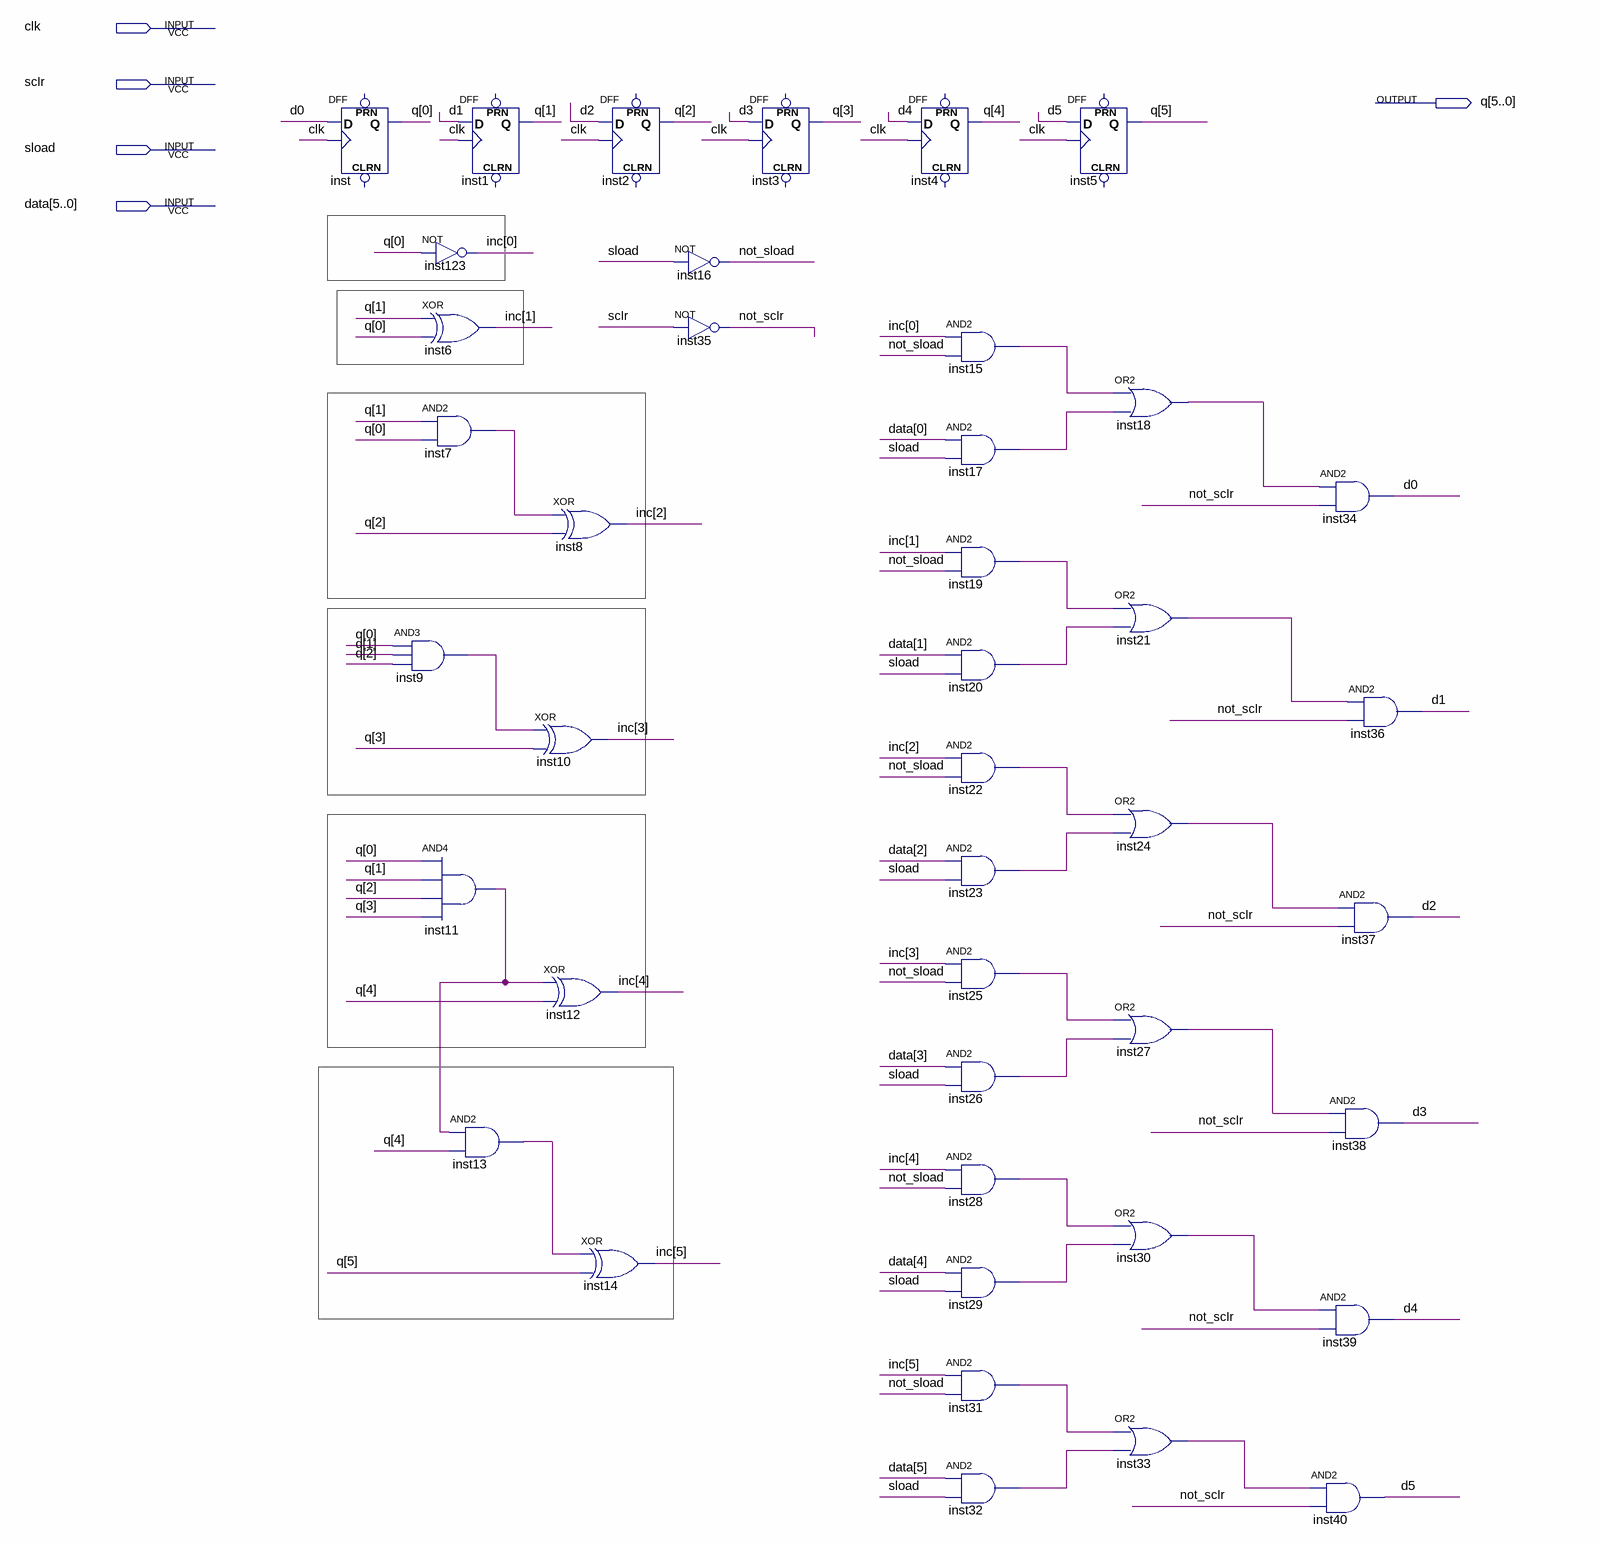
[diagram p0: schematic sheet]
// Quartus schematic contador_6bits.bdf as structural Verilog: 42 symbols, 5 pins
module contador_6bits (
  input  clk,
  input  sclr,
  input  sload,
  input  [5:0] data,
  output [5:0] q
);

  wire d0, d1, d2, d3, d4, d5, inst7_out, inst9_out, inst11_out, inst13_out, inst15_out, inst17_out,
       inst18_out, inst19_out, inst20_out, inst21_out, inst22_out, inst23_out, inst24_out, inst25_out,
       inst26_out, inst27_out, inst28_out, inst29_out, inst30_out, inst31_out, inst32_out, inst33_out,
       not_sclr, not_sload;
  wire [5:0] inc;

  DFF inst (.CLK(clk), .D(d0), .Q(q[0]));  // open: CLRN, PRN
  not inst123 (inc[0], q[0]);
  xor inst6 (inc[1], q[1], q[0]);
  and inst7 (inst7_out, q[1], q[0]);
  and inst9 (inst9_out, q[0], q[1], q[2]);
  and inst11 (inst11_out, q[0], q[1], q[2], q[3]);
  DFF inst1 (.CLK(clk), .D(d1), .Q(q[1]));  // open: CLRN, PRN
  and inst13 (inst13_out, inst11_out, q[4]);
  xor inst8 (inc[2], inst7_out, q[2]);
  xor inst10 (inc[3], inst9_out, q[3]);
  xor inst12 (inc[4], inst11_out, q[4]);
  xor inst14 (inc[5], inst13_out, q[5]);
  DFF inst2 (.CLK(clk), .D(d2), .Q(q[2]));  // open: CLRN, PRN
  not inst16 (not_sload, sload);
  not inst35 (not_sclr, sclr);
  DFF inst3 (.CLK(clk), .D(d3), .Q(q[3]));  // open: CLRN, PRN
  DFF inst4 (.CLK(clk), .D(d4), .Q(q[4]));  // open: CLRN, PRN
  and inst15 (inst15_out, inc[0], not_sload);
  and inst17 (inst17_out, data[0], sload);
  and inst19 (inst19_out, inc[1], not_sload);
  and inst20 (inst20_out, data[1], sload);
  and inst22 (inst22_out, inc[2], not_sload);
  and inst23 (inst23_out, data[2], sload);
  and inst25 (inst25_out, inc[3], not_sload);
  and inst26 (inst26_out, data[3], sload);
  and inst28 (inst28_out, inc[4], not_sload);
  and inst29 (inst29_out, data[4], sload);
  and inst31 (inst31_out, inc[5], not_sload);
  and inst32 (inst32_out, data[5], sload);
  DFF inst5 (.CLK(clk), .D(d5), .Q(q[5]));  // open: CLRN, PRN
  or inst18 (inst18_out, inst15_out, inst17_out);
  or inst21 (inst21_out, inst19_out, inst20_out);
  or inst24 (inst24_out, inst22_out, inst23_out);
  or inst27 (inst27_out, inst25_out, inst26_out);
  or inst30 (inst30_out, inst28_out, inst29_out);
  or inst33 (inst33_out, inst31_out, inst32_out);
  and inst34 (d0, inst18_out, not_sclr);
  and inst38 (d3, inst27_out, not_sclr);
  and inst39 (d4, inst30_out, not_sclr);
  and inst40 (d5, inst33_out, not_sclr);
  and inst36 (d1, inst21_out, not_sclr);
  and inst37 (d2, inst24_out, not_sclr);
endmodule
